# Altium schematic sheet features.SchDoc: Features: User LEDs
size A4; DocumentNumber: ADC-SCH-13; SheetNumber: 13; SheetTotal: 20
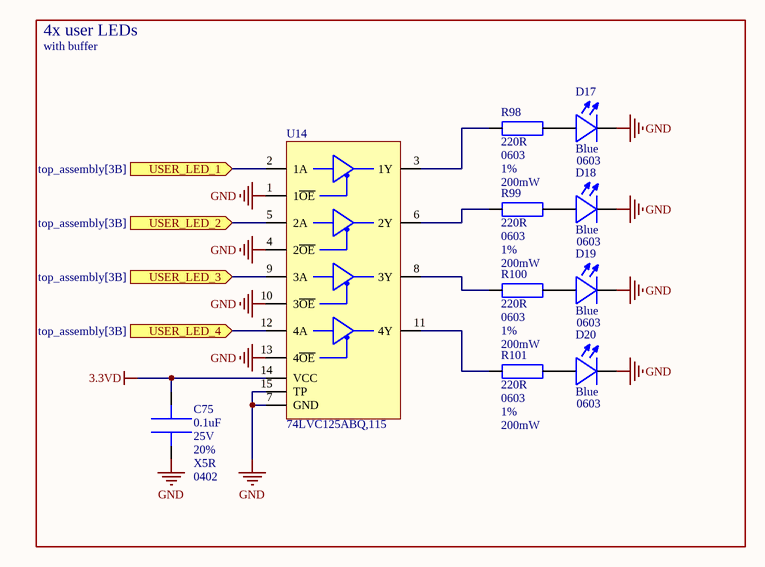
[diagram p0: features.SchDoc]

## Parts
C75  value 0.1uF  Voltage: 25V  Tolerance: 20%  Dielectric: X5R  Package: 0402  [CAPC_0402]  (hidden comment: MSAST105SB5104MFNA01)
D17  package: 0603  color: Blue  [DIOC_0603_LED]  (hidden comment: KB EELP41.12-P1R2-36-3X4X-5-R18)
D18  package: 0603  color: Blue  [DIOC_0603_LED]  (hidden comment: KB EELP41.12-P1R2-36-3X4X-5-R18)
D19  package: 0603  color: Blue  [DIOC_0603_LED]  (hidden comment: KB EELP41.12-P1R2-36-3X4X-5-R18)
D20  package: 0603  color: Blue  [DIOC_0603_LED]  (hidden comment: KB EELP41.12-P1R2-36-3X4X-5-R18)
R98  value 220R  Package: 0603  Tolerance: 1%  Power: 200mW  [RESC_0603]  (hidden comment: AC0603FR-7W220RL)
R99  value 220R  Package: 0603  Tolerance: 1%  Power: 200mW  [RESC_0603]  (hidden comment: AC0603FR-7W220RL)
R100  value 220R  Package: 0603  Tolerance: 1%  Power: 200mW  [RESC_0603]  (hidden comment: AC0603FR-7W220RL)
R101  value 220R  Package: 0603  Tolerance: 1%  Power: 200mW  [RESC_0603]  (hidden comment: AC0603FR-7W220RL)
U14  74LVC125ABQ,115  [IC_DHVQFN-14]

## Ports
USER_LED_1 (in, see top_assembly[3B]), USER_LED_2 (in, see top_assembly[3B]), USER_LED_3 (in, see top_assembly[3B]), USER_LED_4 (in, see top_assembly[3B])

## Nets
3.3VD: C75.1 U14.14(VCC)
GND: C75.2 D17.2 D18.2 D19.2 D20.2 U14.1(1~{OE}) U14.4(2~{OE}) U14.7(GND) U14.10(3~{OE}) U14.13(4~{OE}) U14.15(TP)
USER_LED_1: U14.2(1A) ; port USER_LED_1
USER_LED_2: U14.5(2A) ; port USER_LED_2
USER_LED_3: U14.9(3A) ; port USER_LED_3
USER_LED_4: U14.12(4A) ; port USER_LED_4
NetD17_1: D17.1 R98.1
NetD18_1: D18.1 R99.1
NetD19_1: D19.1 R100.1
NetD20_1: D20.1 R101.1
NetR98_2: R98.2 U14.3(1Y)
NetR99_2: R99.2 U14.6(2Y)
NetR100_2: R100.2 U14.8(3Y)
NetR101_2: R101.2 U14.11(4Y)

## Notes on the sheet
- 4x user LEDs
- with buffer
- Drawn by
- Approved by
- Document type
- Date of issue
- Legal owner
- Title
- Circuit diagram
- File
- AGH Marines
- Document no.
- Revision
- Status
- Sheet
- Size
- Lang.
- /
- A4
- EN

## Library data of the parts
C75 = MSAST105SB5104MFNA01: Multilayer Ceramic Capacitors MLCC - SMD/SMT 25V 0.1uF X5R 0402 20%; Manufacturer: TAIYO YUDEN; Supplier 1: Mouser; Supplier Part Number 1: 963-MSAST105SB5104MF
D17-D20 = KB EELP41.12-P1R2-36-3X4X-5-R18: Single Color LEDs; Supplier 1: Mouser; Supplier Part Number 1: 720-P4112P1R2363X4X5
R98-R101 = AC0603FR-7W220RL: Thick Film Resistors - SMD 220 Ohms 1/5 W 75 V 1% 0603 100 PPM / C - 55 C / + 155 C AEC-Q200; Manufacturer: YAGEO; Supplier 1: Mouser; Supplier Part Number 1: 603-AC0603FR-7W220RL
U14 = 74LVC125ABQ,115: Buffers & Line Drivers SOT762-1 BUFFERS & LINE DVRS; Manufacturer: Nexperia; Package: DHVQFN-14; Supplier 1: Mouser; Supplier Part Number 1: 771-LVC125ABQ115